# Altium schematic sheet Top_Level.SchDoc
size A; Author: Jared Ainsworth; CompanyName: UpRev LLC; Engineer: Jared Ainsworth; Organization: UpRev LLC; Address1: 4807 Commercial Park Dr.; Address2: Austin, TX 78724; Address3: United States; Address4: www.UpRev.com; SheetNumber: 1; SheetTotal: 13
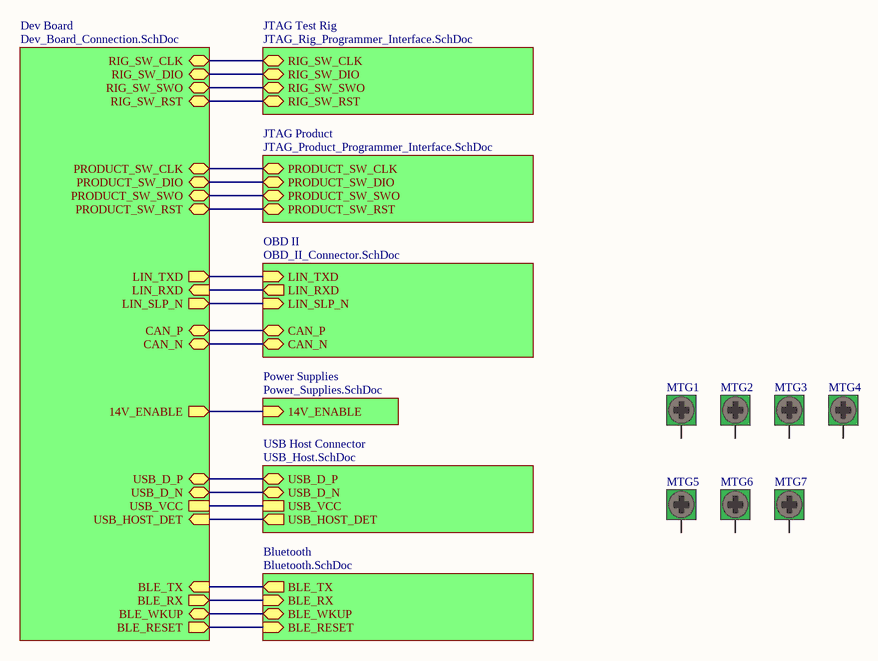
[diagram p0: Top_Level.SchDoc]

## Parts
MTG1  Mounting Hole M3  [Mounting Hole M3]  (value not drawn)  (no BOM)
MTG2  Mounting Hole M3  [Mounting Hole M3]  (value not drawn)  (no BOM)
MTG3  Mounting Hole M3  [Mounting Hole M3]  (value not drawn)  (no BOM)
MTG4  Mounting Hole M3  [Mounting Hole M3]  (value not drawn)  (no BOM)
MTG5  Mounting Hole M3  [Mounting Hole M3]  (value not drawn)  (no BOM)
MTG6  Mounting Hole M3  [Mounting Hole M3]  (value not drawn)  (no BOM)
MTG7  Mounting Hole M3  [Mounting Hole M3]  (value not drawn)  (no BOM)

## Sub-sheets
Bluetooth = Bluetooth.SchDoc: BLE_TX (out), BLE_RX (in), BLE_WKUP (bidir), BLE_RESET (in)
Dev Board = Dev_Board_Connection.SchDoc: RIG_SW_CLK (bidir), RIG_SW_DIO (bidir), RIG_SW_SWO (bidir), RIG_SW_RST (bidir), PRODUCT_SW_CLK (bidir), PRODUCT_SW_DIO (bidir), PRODUCT_SW_SWO (bidir), PRODUCT_SW_RST (bidir), LIN_TXD (out), LIN_RXD (in), LIN_SLP_N (out), CAN_P (bidir), CAN_N (bidir), BLE_RESET (out), BLE_WKUP (bidir), BLE_RX (out), BLE_TX (in), USB_HOST_DET (in), USB_VCC, USB_D_N (bidir), USB_D_P (bidir), 14V_ENABLE (out)
JTAG Product = JTAG_Product_Programmer_Interface.SchDoc: PRODUCT_SW_CLK (bidir), PRODUCT_SW_DIO (bidir), PRODUCT_SW_RST (bidir), PRODUCT_SW_SWO (bidir)
JTAG Test Rig = JTAG_Rig_Programmer_Interface.SchDoc: RIG_SW_CLK (bidir), RIG_SW_DIO (bidir), RIG_SW_SWO (bidir), RIG_SW_RST (bidir)
OBD II = OBD_II_Connector.SchDoc: LIN_TXD (in), LIN_RXD (out), LIN_SLP_N (in), CAN_P (bidir), CAN_N (bidir)
Power Supplies = Power_Supplies.SchDoc: 14V_ENABLE (in)
USB Host Connector = USB_Host.SchDoc: USB_D_P (bidir), USB_D_N (bidir), USB_VCC, USB_HOST_DET (out)

## Nets
(unnamed): sheet Dev Board/RIG_SW_CLK, sheet JTAG Test Rig/RIG_SW_CLK
(unnamed): sheet Dev Board/RIG_SW_DIO, sheet JTAG Test Rig/RIG_SW_DIO
(unnamed): sheet Dev Board/RIG_SW_SWO, sheet JTAG Test Rig/RIG_SW_SWO
(unnamed): sheet Dev Board/RIG_SW_RST, sheet JTAG Test Rig/RIG_SW_RST
(unnamed): sheet Dev Board/PRODUCT_SW_CLK, sheet JTAG Product/PRODUCT_SW_CLK
(unnamed): sheet Dev Board/PRODUCT_SW_DIO, sheet JTAG Product/PRODUCT_SW_DIO
(unnamed): sheet Dev Board/PRODUCT_SW_SWO, sheet JTAG Product/PRODUCT_SW_SWO
(unnamed): sheet Dev Board/PRODUCT_SW_RST, sheet JTAG Product/PRODUCT_SW_RST
(unnamed): sheet Dev Board/LIN_TXD, sheet OBD II/LIN_TXD
(unnamed): sheet Dev Board/LIN_RXD, sheet OBD II/LIN_RXD
(unnamed): sheet Dev Board/LIN_SLP_N, sheet OBD II/LIN_SLP_N
(unnamed): sheet Dev Board/CAN_P, sheet OBD II/CAN_P
(unnamed): sheet Dev Board/CAN_N, sheet OBD II/CAN_N
(unnamed): sheet Dev Board/BLE_RESET, sheet Bluetooth/BLE_RESET
(unnamed): sheet Dev Board/BLE_WKUP, sheet Bluetooth/BLE_WKUP
(unnamed): sheet Dev Board/BLE_RX, sheet Bluetooth/BLE_RX
(unnamed): sheet Dev Board/BLE_TX, sheet Bluetooth/BLE_TX
(unnamed): sheet Dev Board/USB_HOST_DET, sheet USB Host Connector/USB_HOST_DET
(unnamed): sheet Dev Board/USB_VCC, sheet USB Host Connector/USB_VCC
(unnamed): sheet Dev Board/USB_D_N, sheet USB Host Connector/USB_D_N
(unnamed): sheet Dev Board/USB_D_P, sheet USB Host Connector/USB_D_P
(unnamed): sheet Dev Board/14V_ENABLE, sheet Power Supplies/14V_ENABLE

Not connected (* = marked no-connect by the designer): MTG1 1(M3_Mounting_Hole); MTG2 1(M3_Mounting_Hole); MTG3 1(M3_Mounting_Hole); MTG4 1(M3_Mounting_Hole); MTG5 1(M3_Mounting_Hole); MTG6 1(M3_Mounting_Hole); MTG7 1(M3_Mounting_Hole)

## Notes on the sheet
- Title
- Size:
- Engineer:
- A
- Number:
- Revision:
- Sheet
- of
- File:

## Library data of the parts
MTG1-MTG7 = Mounting Hole M3: M3 Mounting Hole; Manufacturer Part Number: DNP; Manufacturer: DNP